# Altium schematic sheet main.SchDoc: ИЛ1429ТО1/1
size 410 x 297 mm; ApprovedBy: Стерхов В.Д.; CheckedBy: Стерхов В.Д.; Author: Сергеев Д.А.; CompanyName: ГК "СНАБЖЕНИЕ"; DrawnBy: Сергеев Д.А.; Engineer: Сергеев Д.А.; Organization: ГК "СНАБЖЕНИЕ"; DocumentNumber: ИЛ1429ТО1/1; Revision: 1; SheetNumber: 1; SheetTotal: 3
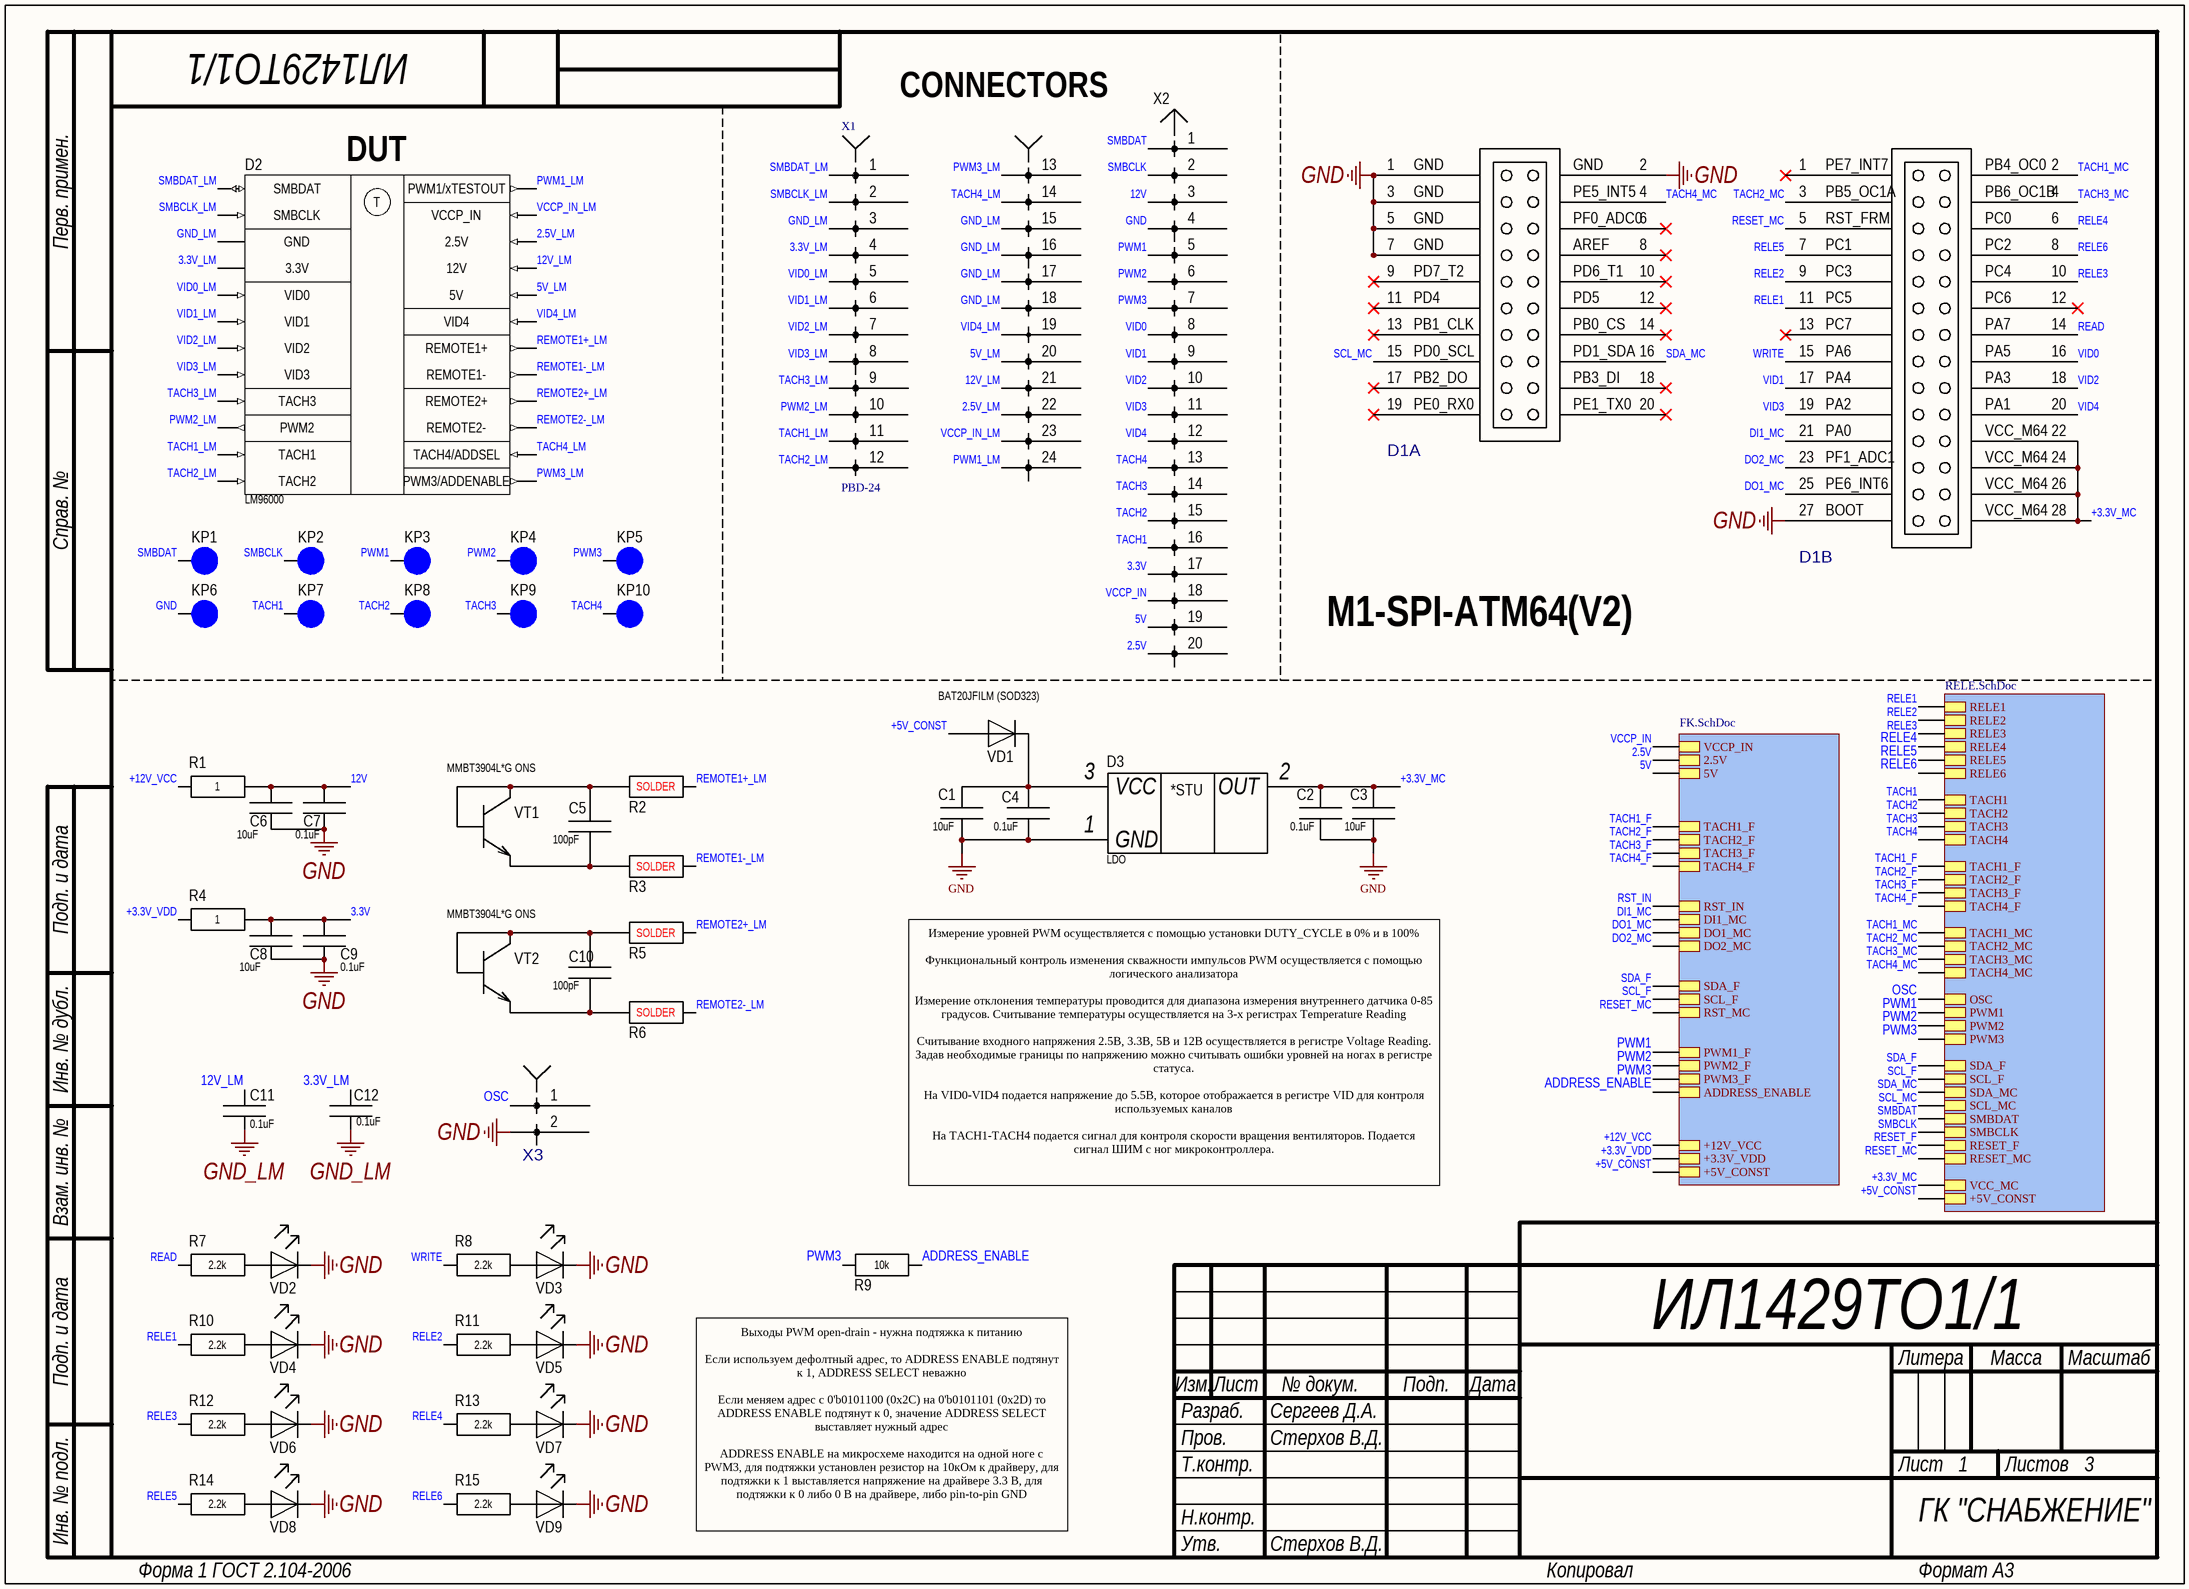
[diagram p0: main.SchDoc]

## Parts
C1  10uF  [0805]
C2  0.1uF  [0805]
C3  10uF  [0805]
C4  0.1uF  [0805]
C5  100pF  [0805]
C6  10uF  [0805]
C7  0.1uF  [0805]
C8  10uF  [0805]
C9  0.1uF  [0805]
C10  100pF  [0805]
C11  0.1uF  [0805]
C12  0.1uF  [0805]
D1  M1-SPI-ATM64(V2)  [M1-SPI-ATM64(V2)]  (value not drawn)  (parts A,B of 2)
D2  LM96000  [TSSOP-24 DIP-7.62]
D3  LDO  [SOT-223]
KP1  Contact  [Contact]  (value not drawn)
KP2  Contact  [Contact]  (value not drawn)
KP3  Contact  [Contact]  (value not drawn)
KP4  Contact  [Contact]  (value not drawn)
KP5  Contact  [Contact]  (value not drawn)
KP6  Contact  [Contact]  (value not drawn)
KP7  Contact  [Contact]  (value not drawn)
KP8  Contact  [Contact]  (value not drawn)
KP9  Contact  [Contact]  (value not drawn)
KP10  Contact  [Contact]  (value not drawn)
R1  1  [0805]
R2  SOLDER  [0603]
R3  SOLDER  [0603]
R4  1  [0805]
R5  SOLDER  [0603]
R6  SOLDER  [0603]
R7  2.2k  [0805]
R8  2.2k  [0805]
R9  10k  [0603]
R10  2.2k  [0805]
R11  2.2k  [0805]
R12  2.2k  [0805]
R13  2.2k  [0805]
R14  2.2k  [0805]
R15  2.2k  [0805]
VD1  BAT20JFILM (SOD323)  [SOD323]
VD2  LED(0805)  [0805(LED)]  (value not drawn)
VD3  LED(0805)  [0805(LED)]  (value not drawn)
VD4  LED(0805)  [0805(LED)]  (value not drawn)
VD5  LED(0805)  [0805(LED)]  (value not drawn)
VD6  LED(0805)  [0805(LED)]  (value not drawn)
VD7  LED(0805)  [0805(LED)]  (value not drawn)
VD8  LED(0805)  [0805(LED)]  (value not drawn)
VD9  LED(0805)  [0805(LED)]  (value not drawn)
VT1  MMBT3904L*G ONS  [SOT-23]
VT2  MMBT3904L*G ONS  [SOT-23]
X1  PBD-24  [PBD-24]
X2  PLD20-2,54  [PLD20-2,54]  (value not drawn)
X3  KLS1-SMA002-B  [KLS1-SMA002-B]  (value not drawn)

## Sub-sheets
UCP_s25 = RELE.SchDoc: SCL_F, +5V_CONST, RELE1, RELE2, RELE3, RESET_F, SDA_MC, VCC_MC, SCL_MC, SDA_F, RESET_MC, TACH2_MC, TACH4, TACH4_MC, TACH3_MC, TACH3, TACH1, TACH1_MC, TACH2, TACH3_F, TACH4_F, TACH1_F, TACH2_F, SMBCLK, SMBDAT, RELE6, RELE5, OSC, RELE4, PWM3, PWM2, PWM1
UCP_s26 = FK.SchDoc: 2.5V, TACH1_F, 5V, DI1_MC, RST_IN, TACH4_F, TACH3_F, TACH2_F, VCCP_IN, SDA_F, +5V_CONST, DO2_MC, RST_MC, SCL_F, DO1_MC, +12V_VCC, +3.3V_VDD, PWM2_F, PWM3_F, PWM1_F, ADDRESS_ENABLE

## Nets
GND: C1.2 C2.2 C3.2 C4.2 C6.2 C7.2 C8.2 C9.2 D1.1X2 D1.2X2 D1.3X2 D1.5X2 D1.7X2 D1.27X3 D3.1(GND) KP6.1 VD2.2(K) VD3.2(K) VD4.2(K) VD5.2(K) VD6.2(K) VD7.2(K) VD8.2(K) VD9.2(K) X2.4 X3.2
GND_LM: C11.2 C12.2 D2.3 X1.3 X1.15 X1.16 X1.17 X1.18
2.5V: X2.20 ; sheet UCP_s26/2.5V
2.5V_LM: D2.22 X1.22
3.3V: C8.1 C9.1 R4.2 X2.17
3.3V_LM: C12.1 D2.4 X1.4
5V: X2.19 ; sheet UCP_s26/5V
5V_LM: D2.20 X1.20
12V: C6.1 C7.1 R1.2 X2.3
12V_LM: C11.1 D2.21 X1.21
+3.3V_MC: C2.1 C3.1 D1.22X3 D1.24X3 D1.26X3 D1.28X3 D3.2(OUT) ; sheet UCP_s25/VCC_MC
+3.3V_VDD: R4.1 ; sheet UCP_s26/+3.3V_VDD
+5V_CONST: VD1.1(A) ; sheet UCP_s25/+5V_CONST, sheet UCP_s26/+5V_CONST
+12V_VCC: R1.1 ; sheet UCP_s26/+12V_VCC
ADDRESS_ENABLE: R9.2 ; sheet UCP_s26/ADDRESS_ENABLE
DI1_MC: D1.21X3 ; sheet UCP_s26/DI1_MC
DO1_MC: D1.25X3 ; sheet UCP_s26/DO1_MC
DO2_MC: D1.23X3 ; sheet UCP_s26/DO2_MC
OSC: X3.1 ; sheet UCP_s25/OSC
PWM1: KP3.1 X2.5 ; sheet UCP_s25/PWM1, sheet UCP_s26/PWM1_F
PWM1_LM: D2.24 X1.24
PWM2: KP4.1 X2.6 ; sheet UCP_s25/PWM2, sheet UCP_s26/PWM2_F
PWM2_LM: D2.10 X1.10
PWM3: KP5.1 R9.1 X2.7 ; sheet UCP_s25/PWM3, sheet UCP_s26/PWM3_F
PWM3_LM: D2.13 X1.13
READ: D1.14X3 R7.1
RELE1: D1.11X3 R10.1 ; sheet UCP_s25/RELE1
RELE2: D1.9X3 R11.1 ; sheet UCP_s25/RELE2
RELE3: D1.10X3 R12.1 ; sheet UCP_s25/RELE3
RELE4: D1.6X3 R13.1 ; sheet UCP_s25/RELE4
RELE5: D1.7X3 R14.1 ; sheet UCP_s25/RELE5
RELE6: D1.8X3 R15.1 ; sheet UCP_s25/RELE6
REMOTE1+_LM: D2.18 R2.2
REMOTE1-_LM: D2.17 R3.2
REMOTE2+_LM: D2.16 R5.2
REMOTE2-_LM: D2.15 R6.2
RESET_F: sheet UCP_s25/RESET_F
RESET_MC: D1.5X3 ; sheet UCP_s25/RESET_MC, sheet UCP_s26/RST_MC
RST_IN: sheet UCP_s26/RST_IN
SCL_F: sheet UCP_s25/SCL_F, sheet UCP_s26/SCL_F
SCL_MC: D1.15X2 ; sheet UCP_s25/SCL_MC
SDA_F: sheet UCP_s25/SDA_F, sheet UCP_s26/SDA_F
SDA_MC: D1.16X2 ; sheet UCP_s25/SDA_MC
SMBCLK: KP2.1 X2.2 ; sheet UCP_s25/SMBCLK
SMBCLK_LM: D2.2 X1.2
SMBDAT: KP1.1 X2.1 ; sheet UCP_s25/SMBDAT
SMBDAT_LM: D2.1 X1.1
TACH1: KP7.1 X2.16 ; sheet UCP_s25/TACH1
TACH1_F: sheet UCP_s25/TACH1_F, sheet UCP_s26/TACH1_F
TACH1_LM: D2.11 X1.11
TACH1_MC: D1.2X3 ; sheet UCP_s25/TACH1_MC
TACH2: KP8.1 X2.15 ; sheet UCP_s25/TACH2
TACH2_F: sheet UCP_s25/TACH2_F, sheet UCP_s26/TACH2_F
TACH2_LM: D2.12 X1.12
TACH2_MC: D1.3X3 ; sheet UCP_s25/TACH2_MC
TACH3: KP9.1 X2.14 ; sheet UCP_s25/TACH3
TACH3_F: sheet UCP_s25/TACH3_F, sheet UCP_s26/TACH3_F
TACH3_LM: D2.9 X1.9
TACH3_MC: D1.4X3 ; sheet UCP_s25/TACH3_MC
TACH4: KP10.1 X2.13 ; sheet UCP_s25/TACH4
TACH4_F: sheet UCP_s25/TACH4_F, sheet UCP_s26/TACH4_F
TACH4_LM: D2.14 X1.14
TACH4_MC: D1.4X2 ; sheet UCP_s25/TACH4_MC
VCCP_IN: X2.18 ; sheet UCP_s26/VCCP_IN
VCCP_IN_LM: D2.23 X1.23
VID0: D1.16X3 X2.8
VID0_LM: D2.5 X1.5
VID1: D1.17X3 X2.9
VID1_LM: D2.6 X1.6
VID2: D1.18X3 X2.10
VID2_LM: D2.7 X1.7
VID3: D1.19X3 X2.11
VID3_LM: D2.8 X1.8
VID4: D1.20X3 X2.12
VID4_LM: D2.19 X1.19
WRITE: D1.15X3 R8.1
NetC1_1: C1.1 C4.1 D3.3(VCC) VD1.2(K)
NetC5_1: C5.1 R2.1 VT1.1(B) VT1.3(K)
NetC5_2: C5.2 R3.1 VT1.2(E)
NetC10_1: C10.1 R5.1 VT2.1(B) VT2.3(K)
NetC10_2: C10.2 R6.1 VT2.2(E)
NetR7_2: R7.2 VD2.1(A)
NetR8_2: R8.2 VD3.1(A)
NetR10_2: R10.2 VD4.1(A)
NetR11_2: R11.2 VD5.1(A)
NetR12_2: R12.2 VD6.1(A)
NetR13_2: R13.2 VD7.1(A)
NetR14_2: R14.2 VD8.1(A)
NetR15_2: R15.2 VD9.1(A)

Not connected (* = marked no-connect by the designer): D1 1X3* 6X2* 8X2* 9X2* 10X2* 11X2* 12X2* 12X3* 13X2* 13X3* 14X2* 17X2* 18X2* 19X2* 20X2*

## Notes on the sheet
- CONNECTORS
- (near D2) DUT
- M1-SPI-ATM64(V2)
- Измерение уровней PWM осуществляется с помощью установки DUTY_CYCLE в 0% и в 100%
  Функциональный контроль изменения скважности импульсов PWM осуществляется с помощью логического анализатора
  Измерение отклонения температуры проводится для диапазона измерения внутреннего датчика 0-85 градусов. Считывание температуры осуществляется на 3-х регистрах Temperature Reading
  Считывание входного напряжения 2.5В, 3.3В, 5В и 12В осуществляется в регистре Voltage Reading. Задав необходимые границы по напряжению можно считывать ошибки уровней на ногах в регистре статуса.
  На VID0-VID4 подается напряжение до 5.5В, которое отображается в регистре VID для контроля используемых каналов
  На TACH1-TACH4 подается сигнал для контроля скорости вращения вентиляторов. Подается сигнал ШИМ с ног микроконтроллера.
- (near R9) Выходы PWM open-drain - нужна подтяжка к питанию
  Если используем дефолтный адрес, то ADDRESS ENABLE подтянут к 1, ADDRESS SELECT неважно
  Если меняем адрес с 0'b0101100 (0x2C) на 0'b0101101 (0x2D) то ADDRESS ENABLE подтянут к 0, значение ADDRESS SELECT выставляет нужный адрес
  ADDRESS ENABLE на микросхеме находится на одной ноге с PWM3, для подтяжки установлен резистор на 10кОм к драйверу, для подтяжки к 1 выставляется напряжение на драйвере 3.3 В, для подтяжки к 0 либо 0 В на драйвере, либо pin-to-pin GND
- Перв. примен.
- Справ. №
- Подп. и дата
- Инв. № дубл.
- Взам. инв. №
- Разраб.
- Изм.
- Лист
- № докум.
- Подп.
- Дата
- Литера
- Масса
- Масштаб
- Пров.
- Т.контр.
- Листов
- Инв. № подл.
- Н.контр.
- Утв.
- Форма 1 ГОСТ 2.104-2006
- Копировал
- Формат А3
- (in symbol AMS1117-3.3 (SOT-223)) *STU
- (in symbol LM96000) SMBDAT; PWM1/xTESTOUT; T; SMBCLK; VCCP_IN; GND; 2.5V; 3.3V; 12V; VID0; 5V; VID1; VID4; VID2; REMOTE1+; VID3; REMOTE1-; TACH3; REMOTE2+; PWM2; REMOTE2-; TACH1; TACH4/ADDSEL; TACH2; PWM3/ADDENABLE
- (in symbol M1-SPI-ATM64(V2), part A) GND; 3; PE5_INT5; 4; 5; PF0_ADC0; 6; 7; AREF; 8; 9; PD7_T2; PD6_T1; 10; 11; PD4; PD5; 12; 13; PB1_CLK; PB0_CS; 14; 15; PD0_SCL; PD1_SDA; 16; 17; PB2_DO; PB3_DI; 18; 19; PE0_RX0; PE1_TX0; 20
- (in symbol M1-SPI-ATM64(V2), part B) PE7_INT7; PB4_OC0; 3; PB5_OC1A; PB6_OC1B; 4; 5; RST_FRM; PC0; 6; 7; PC1; PC2; 8; 9; PC3; PC4; 10; 11; PC5; PC6; 12; 13; PC7; PA7; 14; 15; PA6; PA5; 16; 17; PA4; PA3; 18; 19; PA2; PA1; 20; 21; PA0; VCC_M64; 22; 23; PF1_ADC1; 24; 25; PE6_INT6; 26; 27; BOOT; 28

## Library data of the parts
C1-C12 = C0805: ComponentHeigt: 1.3; Firme: AVX; Leadform: SMD; KIND: Конденсатор; ClassName: *; Component Link: *; ComponentWeigt: *; Packaging: 0805; NN: *; Value: *
D1 = M1-SPI-ATM64(V2): ComponentHeigt: 5.5; Name: Вилка; Specification: Вилка PLD2-2 *; Typ: PLD2-2; ClassName: *; Component Link: *; ComponentWeigt: *; Firme: *; Leadform: *; NN: *; KIND: *
D3 = AMS1117-3.3 (SOT-223)
R1 R4 R7 R8 R10-R15 = R0805 Yageo: ComponentHeigt: 0.6; Firme: Yageo; Leadform: SMD; Kind: Резистор; ClassName: *; ComponentWeigt: *; Component Link: *; Packaging: 0805; NN: *; Value: *
R2 R3 R5 R6 R9 = R0603 Yageo: ComponentHeigt: 0.5; Leadform: SMD; Firme: Yageo; Kind: Резистор; Packaging: 0402; ClassName: *; Component Link: *; NN: *
VD1 = BAT20JFILM (SOD323): ComponentHeigt: 0.75; Leadform: в отверстия; Firme: Kingbright; NN: 24003000; KIND: Светодиод L-1154GD Kingbright; Component Link: *; ClassName: *
VD2-VD9 = LED(0805): ComponentHeigt: 0.75; Leadform: в отверстия; Firme: Kingbright; NN: 24003000; KIND: Светодиод L-1154GD Kingbright; Component Link: *; ClassName: *
VT1 VT2 = MMBT3904L*G ONS: ComponentHeigt: 1.1; Leadform: SMD; NN: 24006226; KIND: Транзистор MMBT3904L*G ONS; ClassName: *; ComponentWeigt: *; Firme: ONS; Packaging: SOT-23
X2 = PLD20-2,54: Посадочное место для проводов на ТО; ComponentHeigt: 5.5; Name: Вилка; Specification: Вилка PLD2-2 *; Typ: PLD2-2; ClassName: *; Component Link: *; ComponentWeigt: *; Firme: *; Leadform: *; NN: *; KIND: *
X3 = KLS1-SMA002-B: ComponentHeigt: 5.5; Name: Вилка; Specification: Вилка PLD2-2 *; Typ: PLD2-2; ClassName: *; Component Link: *; ComponentWeigt: *; Firme: *; Leadform: *; NN: *; KIND: *